# Altium project GTV3.4_Board.PrjPcb (part 5 of 11)

## Sheet Connector_Section.SchDoc
size 420 x 297 mm; DocumentNumber: 17; SheetNumber: 17; SheetTotal: 17
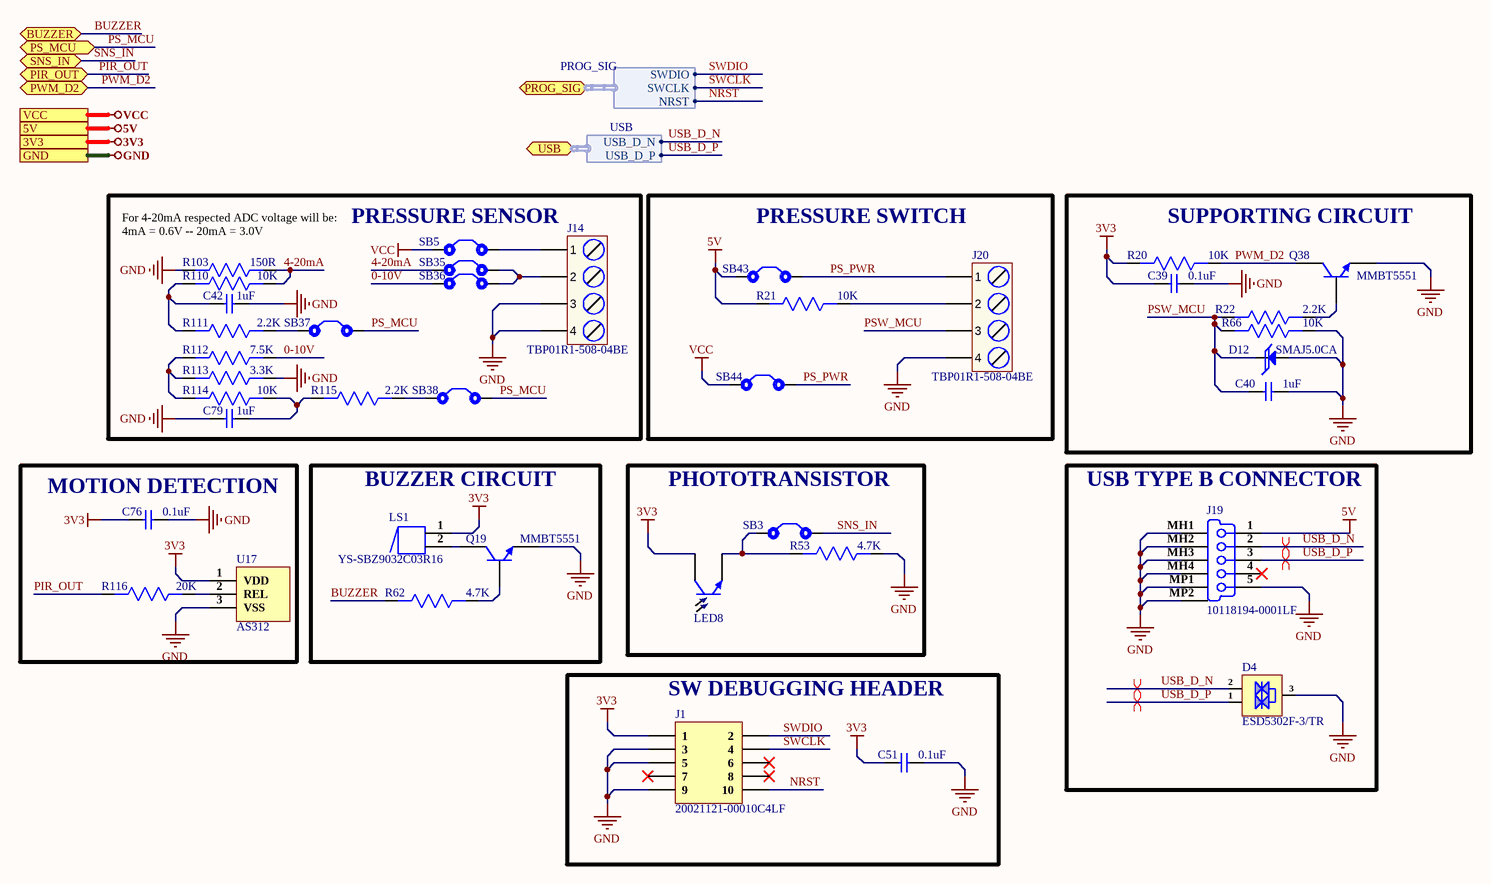
[diagram p7: Connector_Section.SchDoc]

### Parts
C39  0.1uF  [Cap0603]
C40  1uF  [Cap0603]
C42  1uF  [Cap-0603]
C51  0.1uF  [Cap0603]
C76  0.1uF  [Cap0603]
C79  1uF  [Cap-0603]
D4  ESD5302F-3/TR  [Sot-23]
D12  SMAJ5.0CA  [SMA]
J1  20021121-00010C4LF  [20021121-00010C4LF_]
J14  TBP01R1-508-04BE  [TBP01R1-508-04BE]
J19  10118194-0001LF  [10118194-0001LF_]
J20  TBP01R1-508-04BE  [TBP01R1-508-04BE]
LED8  ALS-PT19-315C/L177/TR8  [ALS-PT19-315C/L177/TR]  (value not drawn)
LS1  YS-SBZ9032C03R16  [YS-SBZ9032C03R16]
Q19  MMBT5551  [SOT-23]
Q38  MMBT5551  [SOT-23]
R20  10K  [RES-0603]
R21  10K  [RES-0603]
R22  2.2K  [RES-0603]
R53  4.7K  [RES-0603]
R62  4.7K  [RES-0603]
R66  10K  [RES-0603]
R103  150R  [Res-0603]
R110  10K  [Res-0603]
R111  2.2K  [Res-0603]
R112  7.5K  [Res-0603]
R113  3.3K  [Res-0603]
R114  10K  [Res-0603]
R115  2.2K  [Res-0603]
R116  20K  [Res-0603]
SB3  Solder Bridge  [Solder Bridge]  (value not drawn)
SB5  Solder Bridge  [Solder Bridge]  (value not drawn)
SB35  Solder Bridge  [Solder Bridge]  (value not drawn)
SB36  Solder Bridge  [Solder Bridge]  (value not drawn)
SB37  Solder Bridge  [Solder Bridge]  (value not drawn)
SB38  Solder Bridge  [Solder Bridge]  (value not drawn)
SB43  Solder Bridge  [Solder Bridge]  (value not drawn)
SB44  Solder Bridge  [Solder Bridge]  (value not drawn)
U17  AS312  [AS312]

### Blocks framed on the sheet
PRESSURE SENSOR: C42 C79 J14 R103 R110-R115 SB5 SB35-SB38
PRESSURE SWITCH: J20 R21 SB43 SB44
SUPPORTING CIRCUIT: C39 C40 D12 Q38 R20 R22 R66
MOTION DETECTION: C76 R116 U17
BUZZER CIRCUIT: LS1 Q19 R62
PHOTOTRANSISTOR: LED8 R53 SB3
USB TYPE B CONNECTOR: D4 J19
SW DEBUGGING HEADER: C51 J1

### Ports
3V3, 5V, BUZZER (bidir), GND, PIR_OUT (bidir), PROG_SIG (bidir, harness PROG_SIG), PS_MCU (bidir), PWM_D2 (bidir), SNS_IN (bidir), USB (bidir, harness USB), VCC

### Harnesses
PROG_SIG: SWDIO, SWCLK, NRST
USB: USB_D_N, USB_D_P

### Nets
3V3: C39.1 C51.1 C76.1 J1.1 LED8.1(C) LS1.1 R20.2 U17.1(VDD) ; port 3V3
5V: J19.1(V_BUS_(5V)) R21.2 SB43.1 ; port 5V
GND: C39.2 C40.2 C42.2 C51.2 C76.2 C79.1 D4.3(GND) D12.2(A) J1.3 J1.5 J1.9 J14.3 J14.4 J19.5(GND) J19.MH1(Tab) J19.MH2(Tab) J19.MH3(Tab) J19.MH4(Tab) J19.MP1(Tab) J19.MP2(Tab) J20.4 Q19.2(E) Q38.2(E) R53.1 R66.1 R103.2 R113.1 U17.3(VSS) ; port GND
VCC: SB5.1 SB44.1 ; port VCC
0-10V: R112.1 SB36.1
4-20mA: R103.1 R110.1 SB35.1
BUZZER: R62.2 ; port BUZZER
NRST: J1.10 ; port PROG_SIG.NRST
PIR_OUT: R116.2 ; port PIR_OUT
PS_MCU: SB37.2 SB38.2 ; port PS_MCU
PS_PWR: J20.1 SB43.2 SB44.2
PSW_MCU: C40.1 D12.1(K) J20.3 R22.2 R66.2
PWM_D2: Q38.3(C) R20.1 ; port PWM_D2
SNS_IN: SB3.2 ; port SNS_IN
SWCLK: J1.4 ; port PROG_SIG.SWCLK
SWDIO: J1.2 ; port PROG_SIG.SWDIO
USB_D_N: D4.2(I/O2) J19.2(D-) ; port USB.USB_D_N
USB_D_P: D4.1(I/O1) J19.3(D+) ; port USB.USB_D_P
NetC42_1: C42.1 R110.2 R111.2
NetC79_2: C79.2 R114.1 R115.2
NetJ14_1: J14.1 SB5.2
NetJ14_2: J14.2 SB35.2 SB36.2
NetJ20_2: J20.2 R21.1
NetLED8_2: LED8.2(E) R53.2 SB3.1
NetLS1_2: LS1.2 Q19.3(C)
NetQ19_1: Q19.1(B) R62.1
NetQ38_1: Q38.1(B) R22.1
NetR111_1: R111.1 SB37.1
NetR112_2: R112.2 R113.2 R114.2
NetR115_1: R115.1 SB38.1
NetR116_1: R116.1 U17.2(REL)

Not connected (* = marked no-connect by the designer): J1 6* 7* 8*; J19 4(NC)*

### Layout directives
differential pair; differential pair class USB_D_Lines; net class USB_D; rule Matched Net Lengths [Tolerance = 50mil]; rule Impedance Constraint [Min = 85.00    Max = 90.00    ]: USB_D_N, USB_D_P

### Notes on the sheet
- For 4-20mA respected ADC voltage will be:
  4mA = 0.6V -- 20mA = 3.0V
- File:
- Title:
- Date:
- Page
- Num:
- Total:
- Drawn By: Huzaifa Ali

### Library data of the parts
C39 C51 C76 = CC0603ZRY5V9BB104: CAP CER 0.1UF 50V Y5V 0603; Manufacturer: Yageo; Capacitance: 100nF; Tolerance: 80%; Supplier 1: Digi-Key; Manufacturer Part Number: CC0603ZRY5V9BB104; Stock 1: 15000880; Pricing 1: 1=0.1, 10=0.075, 100=0.0334, 500=0.02386, 1000=0.01874 (USD); Mount: Surface Mount; Case/Package: 0603; Number of Pins: 2; Case Code (Metric): 1608; Case Code (Imperial): 0603; Min Operating Temperature: -30°C; Max Operating Temperature: 85°C; Dielectric: Y5V; Voltage Rating: 50V; Package Quantity: 1; Packaging: Tape and Reel; Voltage Rating (DC): 50V; Termination: SMD/SMT; Composition: Ceramic; Voltage: 50V; Length: 1.6mm; Height: 0.8mm; Width: 0.031inch; Thickness: 0.035inch; Depth: 0.8mm; Radiation Hardening: No; REACH SVHC: No SVHC; Lead Free: Lead Free; Halogen Free: Halogen Free; ComponentLink1URL: http://www.yageo.com/documents/recent/UPY-GPHC_Y5V_6.3V-to-50V_8.pdf?src-supplier=Digi-Key; ComponentLink1Description: http://www.yageo.com/documents/recent/UPY-GPHC_Y5V_6.3V-to-50V_8.pdf?src-supplier=Digi-Key; ComponentLink2URL: http://www.yageo.com/documents/recent/UPY-GPHC_Y5V_6.3V-to-50V_5.pdf?src-supplier=Avnet+Europe; ComponentLink2Description: http://www.yageo.com/documents/recent/UPY-GPHC_Y5V_6.3V-to-50V_5.pdf?src-supplier=Avnet+Europe; ComponentLink3URL: https://www.verical.com/server-webapp/html/getDatasheet?partID=403611&src-supplier=Verical; ComponentLink3Description: https://www.verical.com/server-webapp/html/getDatasheet?partID=403611&src-supplier=Verical; ComponentLink4URL: http://www.mouser.com/ds/2/447/Yageo_UPY-GP_NP0_16V-to-50V_9-358835.pdf?src-supplier=Mouser; ComponentLink4Description: http://www.mouser.com/ds/2/447/Yageo_UPY-GP_NP0_16V-to-50V_9-358835.pdf?src-supplier=Mouser; ComponentLink5URL: http://www.farnell.com/datasheets/1132289.pdf?src-supplier=Element14; ComponentLink5Description: http://www.farnell.com/datasheets/1132289.pdf?src-supplier=Element14; Supplier Part Number 1: 311-1343-1-ND
C40 C42 C79 = CC0603KRX5R8BB105: CAP CER 1UF 25V X5R 0603; Manufacturer: Yageo; Tolerance: 10%; Supplier 1: Digi-Key; Manufacturer Part Number: CC0603KRX5R8BB105; Mount: Surface Mount; Case/Package: 0603; Number of Pins: 2; Case Code (Metric): 1608; Case Code (Imperial): 0603; Min Operating Temperature: -55°C; Max Operating Temperature: 85°C; Capacitance: 1uF; Dielectric: X5R; Package Quantity: 1; Voltage Rating: 25V; Packaging: Tape and Reel; Termination: SMD/SMT; Voltage Rating (DC): 25V; Length: 1.6mm; Height: 0.8mm; Width: 0.031inch; Thickness: 0.035inch; Depth: 0.8mm; Radiation Hardening: No; REACH SVHC: No SVHC; Lead Free: Lead Free; Halogen Free: Halogen Free
  C40: Stock 1: 1419041; Pricing 1: 1=0.1, 10=0.069, 100=0.0307, 500=0.0219, 1000=0.0172 (USD); ComponentLink1URL: http://www.yageo.com/documents/recent/UPY-GPHC_X5R_4V-to-50V_25.pdf?src-supplier=Digi-Key; ComponentLink1Description: http://www.yageo.com/documents/recent/UPY-GPHC_X5R_4V-to-50V_25.pdf?src-supplier=Digi-Key; ComponentLink2URL: http://www.yageo.com/documents/recent/UPY-GPHC_X5R_4V-to-50V_12.pdf?src-supplier=Avnet+Europe; ComponentLink2Description: http://www.yageo.com/documents/recent/UPY-GPHC_X5R_4V-to-50V_12.pdf?src-supplier=Avnet+Europe; ComponentLink3URL: http://www.farnell.com/datasheets/1525783.pdf?src-supplier=Element14; ComponentLink3Description: http://www.farnell.com/datasheets/1525783.pdf?src-supplier=Element14; ComponentLink4URL: http://www.yageo.com/documents/recent/UPY-GPHC_X5R_4V-to-50V_12.pdf?src-supplier=Avnet; ComponentLink4Description: http://www.yageo.com/documents/recent/UPY-GPHC_X5R_4V-to-50V_12.pdf?src-supplier=Avnet; Supplier Part Number 1: 311-1445-6-ND
  C42 C79: RoHS: Yes; Category: Ceramic Capacitors; Stock 1: 919939; Pricing 1: 1=0.12000, 10=0.08400, 50=0.04760, 100=0.03940, 500=0.02764, 1000=0.02288 (USD); Series: CC; Construction: Flat; RoHS Compliant: Yes; ComponentLink1URL: https://datasheet.ciiva.com/176/mlccorderingcode-176785.pdf?src-supplier=Digi-Key; ComponentLink1Description: https://datasheet.ciiva.com/176/mlccorderingcode-176785.pdf?src-supplier=Digi-Key; ComponentLink2URL: https://datasheet.ciiva.com/176/mlccorderingcode-176786.pdf?src-supplier=Digi-Key; ComponentLink2Description: https://datasheet.ciiva.com/176/mlccorderingcode-176786.pdf?src-supplier=Digi-Key; ComponentLink3URL: https://datasheet.ciiva.com/176/mlccorderingcode-176787.pdf?src-supplier=Digi-Key; ComponentLink3Description: https://datasheet.ciiva.com/176/mlccorderingcode-176787.pdf?src-supplier=Digi-Key; ComponentLink4URL: https://datasheet.ciiva.com/17436/upy-gphc-x5r-4v-to-50v-12-17436952.pdf?src-supplier=Avnet+Europe; ComponentLink4Description: https://datasheet.ciiva.com/17436/upy-gphc-x5r-4v-to-50v-12-17436952.pdf?src-supplier=Avnet+Europe; ComponentLink5URL: https://datasheet.ciiva.com/7978/1525783-7978171.pdf?src-supplier=Element14; ComponentLink5Description: https://datasheet.ciiva.com/7978/1525783-7978171.pdf?src-supplier=Element14; ComponentLink6URL: https://datasheet.ciiva.com/11586/upy-gphc-x5r-4v-to-50v-12-11586318.pdf?src-supplier=Avnet; ComponentLink6Description: https://datasheet.ciiva.com/11586/upy-gphc-x5r-4v-to-50v-12-11586318.pdf?src-supplier=Avnet; Supplier Part Number 1: 311-1445-1-ND; LCSC Part Number: C14664
D4 = ESD5302F-3/TR: 16A 20V 7V 5V@Max Unidirectional SOT-23 TVS ROHS; Manufacturer: WILLSEMI; Item Type: Diode; Manufacturer Part Number: ESD5302F-3/TR; Package: SOT-23; LCSC Part Number: C239643; ComponentLink1Description: LCSC; ComponentLink1URL: https://www.lcsc.com/product-detail/TVS_WILLSEMI-Will-Semicon-ESD5302F-3-TR_C239643.html
D12 = SMAJ5.0CA: TVS DIODE 5VWM 9.2VC SMA; Manufacturer: FTR; Item Type: C693487; Manufacturer Part Number: SMAJ5.0CA; Package: SMA(DO-214AC); LCSC Part Number: Diode; ComponentLink1Description: LCSC; ComponentLink1URL: https://www.lcsc.com/product-detail/TVS_GOODWORK-SMAJ5-0CA_C908809.html
J1 = 20021121-00010C4LF: CONN HEADER SMD 10POS 1.27MM; Manufacturer: Amphenol FCI; Number of Contacts: 10; Contact Resistance: 30mR; Current Rating: 1A; Voltage Rating: 125V; Insulation Resistance: 100MR; Gender: Male; Connector Type: Male Pin,Header; Row Spacing: 0.05inch; Stack Height: 3mm; Item Type: Jtag Header; Supplier 1: Digi-Key; Manufacturer Part Number: 20021121-00010C4LF; Stock 1: 0; Pricing 1: 1=0.87, 10=0.761, 100=0.6563 (USD); Mount: Surface Mount; Contact Plating: Gold; Contact Material: Copper Alloy,Copper,Gold; Color: Black; Housing Color: Black; Housing Material: Thermoplastic; Min Operating Temperature: -40°C; Max Operating Temperature: 85°C; Number of Rows: 2; Termination: Solder; Packaging: Tape and Reel; Package Quantity: 600; Number of Positions: 10; Max Voltage Rating (AC): 125V; Orientation: Straight; Length: 6.35mm; Pitch: 1.27mm; Contact Mating Length: 0.12inch; Depth: 3.4mm; Radiation Hardening: No; REACH SVHC: No SVHC; ComponentLink1URL: https://www.verical.com/server-webapp/html/getDatasheet?partID=177140&src-supplier=Verical; ComponentLink1Description: https://www.verical.com/server-webapp/html/getDatasheet?partID=177140&src-supplier=Verical; ComponentLink2URL: http://portal.fciconnect.com/Comergent/fci/drawing/20021121.pdf?src-supplier=Avnet; ComponentLink2Description: http://portal.fciconnect.com/Comergent/fci/drawing/20021121.pdf?src-supplier=Avnet; ComponentLink3URL: https://cdn.amphenol-icc.com/media/wysiwyg/files/drawing/20021121.pdf?src-supplier=Digi-Key; ComponentLink3Description: https://cdn.amphenol-icc.com/media/wysiwyg/files/drawing/20021121.pdf?src-supplier=Digi-Key; ComponentLink4URL: http://portal.fciconnect.com/Comergent/fci/drawing/20021121.pdf?src-supplier=Avnet+Europe; ComponentLink4Description: http://portal.fciconnect.com/Comergent/fci/drawing/20021121.pdf?src-supplier=Avnet+Europe; ComponentLink5URL: https://media.digikey.com/pdf/Data%20Sheets/FCI%20PDFs/Minitek%20127_Catalog.pdf?src-supplier=Digi-Key; ComponentLink5Description: https://media.digikey.com/pdf/Data%20Sheets/FCI%20PDFs/Minitek%20127_Catalog.pdf?src-supplier=Digi-Key; ComponentLink6URL: http://portal.fciconnect.com/Comergent//fci/drawing/20021121.pdf?src-supplier=Mouser; ComponentLink6Description: http://portal.fciconnect.com/Comergent//fci/drawing/20021121.pdf?src-supplier=Mouser; Supplier Part Number 1: 609-3695-6-ND; LCSC Part Number: C150517
J14 J20 = TBP01R1-508-04BE: TERMINAL BLOCK, PLUGGABLE, 5.08,; Manufacturer: CUI Devices; Supplier 1: Arrow Electronics; Manufacturer Part Number: TBP01R1-508-04BE; RoHS: Yes; Category: Terminal Blocks; Stock 1: 697; Pricing 1: 1=0.77380, 10=0.29040, 25=0.28750, 50=0.25070, 200=0.24820, 400=0.24580, 600=0.22570 (USD); Supplier Part Number 1: TBP01R1-508-04BE
J19 = 10118194-0001LF: CONN RCPT USB2.0 MICRO B SMD R/A; Manufacturer: Amphenol FCI; Gender: Receptacle; Current Rating: 1.8A; Connector Type: USB,Receptacle; Number of Contacts: 5; Insulation Resistance: 1GR; Number of Ports: 1; Max Voltage Rating (AC): 100V; Pitch: 0.65mm; Item Type: USB Connector; Supplier 1: Digi-Key; Manufacturer Part Number: 10118194-0001LF; Stock 1: 35943; Pricing 1: 1=0.43, 10=0.405, 25=0.3648, 50=0.3242, 100=0.3107, 250=0.28368, 500=0.27016 (USD); Mount: Surface Mount,Horizontal; Color: Black; Contact Material: Copper Alloy; Contact Plating: Gold; Number of Terminals: 5; Housing Material: Polymer; Min Operating Temperature: -55°C; Max Operating Temperature: 85°C; Package Quantity: 9600; Packaging: Tape and Reel; Termination: Solder; Orientation: Right Angle; Features: Shielded; Length: 8.05mm; Depth: 5mm; Radiation Hardening: No; Lead Free: Lead Free; Flammability Rating: UL94 V-0; ComponentLink1URL: http://www.amphenol-icc.com/media/wysiwyg/files/drawing/10118194.pdf?src-supplier=Digi-Key; ComponentLink1Description: http://www.amphenol-icc.com/media/wysiwyg/files/drawing/10118194.pdf?src-supplier=Digi-Key; ComponentLink2URL: https://cdn.amphenol-icc.com/media/wysiwyg/files/drawing/10118194.pdf?src-supplier=Mouser; ComponentLink2Description: https://cdn.amphenol-icc.com/media/wysiwyg/files/drawing/10118194.pdf?src-supplier=Mouser; ComponentLink3URL: https://cdn.amphenol-icc.com/media/wysiwyg/files/drawing/10118194.pdf?src-supplier=Verical; ComponentLink3Description: https://cdn.amphenol-icc.com/media/wysiwyg/files/drawing/10118194.pdf?src-supplier=Verical; Supplier Part Number 1: 609-4618-1-ND; LCSC Part Number: C132563
LED8 = ALS-PT19-315C/L177/TR8: SENSOR PHOTO 630NM 2SMD; Manufacturer: Everlight; Rise Time: 0.11ms; Fall Time: 0.22ms; Lens Style: Flat; Collector Emitter Breakdown Voltage: 5.5V; Polarity: NPN; Number of Elements: 1; Dark Current: 100nA; Supplier 1: Digi-Key; Manufacturer Part Number: ALS-PT19-315C/L177/TR8; RoHS: Yes; Category: Sensors; Stock 1: 41849; Pricing 1: 1=0.46000, 5=0.41800, 10=0.37100, 25=0.33200, 50=0.29180, 100=0.24880, 500=0.20576, 1000=0.17226 (USD); Mount: Surface Mount; Case/Package: SMD/SMT; Number of Pins: 2; Min Operating Temperature: -40°C; Max Operating Temperature: 85°C; Wavelength: 630nm; Packaging: Tape and Reel; Package Quantity: 1; Max Breakdown Voltage: 5.5V; Radiation Hardening: No; RoHS Compliant: Yes; ComponentLink1URL: https://datasheet.ciiva.com/12092/als-pt19-315c-l177-tr-datasheet-34741-12092024.pdf?src-supplier=Mouser; ComponentLink1Description: https://datasheet.ciiva.com/12092/als-pt19-315c-l177-tr-datasheet-34741-12092024.pdf?src-supplier=Mouser; ComponentLink2URL: https://datasheet.ciiva.com/4270/alspt19315cl177-tr8-1810-4270796.pdf?src-supplier=Arrow+Electronics; ComponentLink2Description: https://datasheet.ciiva.com/4270/alspt19315cl177-tr8-1810-4270796.pdf?src-supplier=Arrow+Electronics; Supplier Part Number 1: 1080-1244-1-ND
LS1 = YS-SBZ9032C03R16: NO 2700Hz 85dB @ 3V, 10cm 3V Φ9mm SMD,9x3.2mm Buzzers RoHS; Manufacturer: Fengming; Operating Voltage: 2 ~ 4V; Package: SMD,9x3.2mm; Frequency - Self Resonant: 2700Hz; Rated Voltage: 3V
Q19 Q38 = MMBT5551: TRANS NPN 160V 0.6A SOT-23; Manufacturer: ON Semiconductor; Manufacturer Part Number: MMBT5551LT1G; Max Power Dissipation: 225mW; Max Collector Current: 600mA; Collector Base Voltage (VCBO): 180V; Emitter Base Voltage (VEBO): 6V; Element Configuration: Single; hFE Min: 80; Power Dissipation: 300mW; Number of Elements: 1; Collector Emitter Saturation Voltage: 150mV; Collector-emitter Voltage-Max: 200mV; Supplier 1: Digi-Key; RoHS: Yes; Category: BJTs; Pricing 1: 1=0.22000, 10=0.17700, 100=0.09370, 500=0.06162, 1000=0.04190 (USD); Case/Package: SOT-23-3; Number of Pins: 3; Weight: 0.01lb; Contact Plating: Tin,Matte; Min Operating Temperature: -55°C; Max Operating Temperature: 150°C; Packaging: Tape and Reel; Collector Emitter Voltage (VCEO): 160V; Polarity: NPN; Package Quantity: 1; Collector Emitter Breakdown Voltage: 160V; Current Rating: 600mA; Voltage Rating (DC): 160V; Max Breakdown Voltage: 160V; Series: -; Length: 2.9mm; Width: 1.3mm; Height: 0.94mm; Radiation Hardening: No; Lead Free: Lead Free; REACH SVHC: No SVHC; RoHS Compliant: Yes; ComponentLink1URL: https://datasheet.ciiva.com/976/mmbt5550lt1-d-976512.pdf?src-supplier=Digi-Key; ComponentLink1Description: https://datasheet.ciiva.com/976/mmbt5550lt1-d-976512.pdf?src-supplier=Digi-Key; ComponentLink2URL: https://datasheet.ciiva.com/34303/2011387-34303825.pdf?src-supplier=Jameco; ComponentLink2Description: https://datasheet.ciiva.com/34303/2011387-34303825.pdf?src-supplier=Jameco; ComponentLink3URL: https://datasheet.ciiva.com/15139/getdatasheetpartid-92641-15139178.pdf?src-supplier=Verical; ComponentLink3Description: https://datasheet.ciiva.com/15139/getdatasheetpartid-92641-15139178.pdf?src-supplier=Verical; ComponentLink4URL: https://datasheet.ciiva.com/16984/0900766b8078eb1b-16984971.pdf?src-supplier=Allied+Electronics; ComponentLink4Description: https://datasheet.ciiva.com/16984/0900766b8078eb1b-16984971.pdf?src-supplier=Allied+Electronics; ComponentLink5URL: https://datasheet.ciiva.com/976/mmbt5550lt1-d-976513.pdf?src-supplier=Digi-Key; ComponentLink5Description: https://datasheet.ciiva.com/976/mmbt5550lt1-d-976513.pdf?src-supplier=Digi-Key; ComponentLink6URL: https://datasheet.ciiva.com/4722/mmbt5550lt1-d-111393-4722711.pdf?src-supplier=Mouser; ComponentLink6Description: https://datasheet.ciiva.com/4722/mmbt5550lt1-d-111393-4722711.pdf?src-supplier=Mouser; ComponentLink7URL: https://datasheet.ciiva.com/16478/mmbt5550lt1-d-16478568.pdf?src-supplier=Avnet+Asia; ComponentLink7Description: https://datasheet.ciiva.com/16478/mmbt5550lt1-d-16478568.pdf?src-supplier=Avnet+Asia; ComponentLink8URL: https://datasheet.ciiva.com/7972/mmbt5550lt1-d-7972073.pdf?src-supplier=Element14; ComponentLink8Description: https://datasheet.ciiva.com/7972/mmbt5550lt1-d-7972073.pdf?src-supplier=Element14; ComponentLink9URL: https://datasheet.ciiva.com/25997/mmbt5550lt1-d-25997449.pdf?src-supplier=Avnet+Europe; ComponentLink9Description: https://datasheet.ciiva.com/25997/mmbt5550lt1-d-25997449.pdf?src-supplier=Avnet+Europe; ComponentLink10URL: https://datasheet.ciiva.com/7972/mmbt5550lt1-d-7972075.pdf?src-supplier=Element14; ComponentLink10Description: https://datasheet.ciiva.com/7972/mmbt5550lt1-d-7972075.pdf?src-supplier=Element14; ComponentLink11URL: https://datasheet.ciiva.com/11197/mmbt5550lt1-d-11197404.pdf?src-supplier=Avnet; ComponentLink11Description: https://datasheet.ciiva.com/11197/mmbt5550lt1-d-11197404.pdf?src-supplier=Avnet; ComponentLink12URL: https://datasheet.ciiva.com/976/mmbt5550lt1-d-976511.pdf?src-supplier=Digi-Key; ComponentLink12Description: https://datasheet.ciiva.com/976/mmbt5550lt1-d-976511.pdf?src-supplier=Digi-Key; ComponentLink13URL: https://datasheet.ciiva.com/16342/mmbt5550lt1-d-16342687.pdf?src-supplier=Future+Electronics; ComponentLink13Description: https://datasheet.ciiva.com/16342/mmbt5550lt1-d-16342687.pdf?src-supplier=Future+Electronics; Supplier Part Number 1: MMBT5551LT1GOSDKR-ND
R20 R21 R66 = AC0603JR-0710KL: RES SMD 10K OHM 5% 1/10W 0603; Manufacturer: Yageo; Voltage Rating: 50V; Resistance: 10kR; Power Rating: 100mW; Temperature Coefficient: 100ppm/°C; Supplier 1: Future Electronics; Manufacturer Part Number: AC0603JR-0710KL; RoHS: Yes; Category: Chip SMD Resistors; Stock 1: 1533000; Pricing 1: 5000=0.00540 (USD); Case/Package: 0603; Case Code (Imperial): 0603; Case Code (Metric): 1608; Size Code: 0603; Min Operating Temperature: -55°C; Max Operating Temperature: 155°C; Packaging: Tape and Reel; Tolerance: 5%; Package Quantity: 1; Resistor Type: Thick Film; Termination: SMD/SMT; Number of Terminations: 2; Max Power Dissipation: 100mW; Features: Moisture Resistant,Automotive AEC-Q200,Anti-Sulfur; Series: AC; Construction: Rectangular; Length: 0.063inch; Width: 0.031inch; Height: 0.022inch; Depth: 0.8mm; Military Standard: Not; Lead Free: Lead Free; RoHS Compliant: Yes; ComponentLink1URL: https://datasheet.ciiva.com/5562/pyu-ac-51-rohs-l-2-5562553.pdf?src-supplier=Mouser; ComponentLink1Description: https://datasheet.ciiva.com/5562/pyu-ac-51-rohs-l-2-5562553.pdf?src-supplier=Mouser; Supplier Part Number 1: 1029044
R22 = RC0603FR-072K2L: RES SMD 2.2K OHM 1% 1/10W 0603; Manufacturer: Yageo Phycomp; Temperature Coefficient: 100ppm/°C; Resistance: 2.2kR; Power Rating: 100mW; Voltage Rating (DC): 50V; Supplier 1: Digi-Key; Manufacturer Part Number: RC0603FR-072K2L; Stock 1: 10587920; Pricing 1: 1=0.1, 10=0.023, 100=0.0094, 1000=0.00421, 2500=0.00366 (USD); Mount: Surface Mount; Case/Package: 0603; Number of Pins: 2; Min Operating Temperature: -55°C; Max Operating Temperature: 155°C; Tolerance: 1%; Packaging: Cut Tape; Length: 1.6mm; Height: 0.45mm; Width: 800um; Depth: 0.8mm; REACH SVHC: No SVHC; Lead Free: Lead Free; Supplier Part Number 1: 311-2.20KHRCT-ND
R53 = RC0603FR-074K7L: RES SMD 4.7K OHM 1% 1/10W 0603; Manufacturer: Yageo; Resistance: 4.7kR; Temperature Coefficient: 100ppm/°C; Voltage Rating (DC): 50V; Power Rating: 100mW; Supplier 1: Digi-Key; Manufacturer Part Number: RC0603FR-074K7L; Stock 1: 1924316; Pricing 1: 1=0.10000, 10=0.02400, 100=0.00970, 1000=0.00436, 2500=0.00378 (USD); Case/Package: 0603; Number of Pins: 2; Case Code (Imperial): 0603; Case Code (Metric): 1608; Min Operating Temperature: -55°C; Max Operating Temperature: 155°C; Tolerance: 1%; Packaging: Tape and Reel; Voltage Rating: 50V; Termination: SMD/SMT; Military Standard: Not; Length: 1.6mm; Width: 0.8mm; Depth: 0.8mm; REACH SVHC: No SVHC; Lead Free: Lead Free; ComponentLink1URL: https://datasheet.ciiva.com/15189/getdatasheetpartid-422754-15189760.pdf?src-supplier=Verical; ComponentLink1Description: https://datasheet.ciiva.com/15189/getdatasheetpartid-422754-15189760.pdf?src-supplier=Verical; Supplier Part Number 1: 311-4.70KHRCT-ND; RoHS: Yes; Category: Chip SMD Resistors; Size Code: 0603; Resistor Type: Thick Film; Features: Moisture Resistant; Series: RC; Max Power Dissipation: 100mW; Number of Terminations: 2; Construction: Rectangular; Resistance Tolerance: 1%; Height: 0.45mm; Lead Pitch: 0.3mm; RoHS Compliant: Yes; ComponentLink2URL: https://datasheet.ciiva.com/22747/443971-22747528.pdf?src-supplier=Element14; ComponentLink2Description: https://datasheet.ciiva.com/22747/443971-22747528.pdf?src-supplier=Element14; ComponentLink3URL: https://datasheet.ciiva.com/7660/38590-7660794.pdf?src-supplier=Element14; ComponentLink3Description: https://datasheet.ciiva.com/7660/38590-7660794.pdf?src-supplier=Element14; ComponentLink4URL: https://datasheet.ciiva.com/7746/1868787-7746365.pdf?src-supplier=Element14; ComponentLink4Description: https://datasheet.ciiva.com/7746/1868787-7746365.pdf?src-supplier=Element14; ComponentLink5URL: https://datasheet.ciiva.com/46440/1868787-46440909.pdf?src-supplier=Element14; ComponentLink5Description: https://datasheet.ciiva.com/46440/1868787-46440909.pdf?src-supplier=Element14; ComponentLink6URL: https://datasheet.ciiva.com/7746/1738695-7746366.pdf?src-supplier=Element14; ComponentLink6Description: https://datasheet.ciiva.com/7746/1738695-7746366.pdf?src-supplier=Element14
R62 = RC0603FR-074K7L: RES SMD 4.7K OHM 1% 1/10W 0603; Manufacturer: Yageo; Resistance: 4.7kR; Temperature Coefficient: 100ppm/°C; Power Rating: 100mW; Voltage Rating (DC): 50V; Supplier 1: Digi-Key; Manufacturer Part Number: RC0603FR-074K7L; RoHS: Yes; Category: Chip SMD Resistors; Stock 1: 1924316; Pricing 1: 1=0.10000, 10=0.02400, 100=0.00970, 1000=0.00436, 2500=0.00378 (USD); Case/Package: 0603; Number of Pins: 2; Case Code (Imperial): 0603; Case Code (Metric): 1608; Size Code: 0603; Min Operating Temperature: -55°C; Max Operating Temperature: 155°C; Tolerance: 1%; Resistor Type: Thick Film; Packaging: Tape and Reel; Voltage Rating: 50V; Termination: SMD/SMT; Features: Moisture Resistant; Series: RC; Max Power Dissipation: 100mW; Number of Terminations: 2; Construction: Rectangular; Resistance Tolerance: 1%; Length: 1.6mm; Width: 0.8mm; Height: 0.45mm; Depth: 0.8mm; Lead Pitch: 0.3mm; REACH SVHC: No SVHC; Lead Free: Lead Free; RoHS Compliant: Yes; Military Standard: Not; ComponentLink1URL: https://datasheet.ciiva.com/15189/getdatasheetpartid-422754-15189760.pdf?src-supplier=Verical; ComponentLink1Description: https://datasheet.ciiva.com/15189/getdatasheetpartid-422754-15189760.pdf?src-supplier=Verical; ComponentLink2URL: https://datasheet.ciiva.com/22747/443971-22747528.pdf?src-supplier=Element14; ComponentLink2Description: https://datasheet.ciiva.com/22747/443971-22747528.pdf?src-supplier=Element14; ComponentLink3URL: https://datasheet.ciiva.com/7660/38590-7660794.pdf?src-supplier=Element14; ComponentLink3Description: https://datasheet.ciiva.com/7660/38590-7660794.pdf?src-supplier=Element14; ComponentLink4URL: https://datasheet.ciiva.com/7746/1868787-7746365.pdf?src-supplier=Element14; ComponentLink4Description: https://datasheet.ciiva.com/7746/1868787-7746365.pdf?src-supplier=Element14; ComponentLink5URL: https://datasheet.ciiva.com/46440/1868787-46440909.pdf?src-supplier=Element14; ComponentLink5Description: https://datasheet.ciiva.com/46440/1868787-46440909.pdf?src-supplier=Element14; ComponentLink6URL: https://datasheet.ciiva.com/7746/1738695-7746366.pdf?src-supplier=Element14; ComponentLink6Description: https://datasheet.ciiva.com/7746/1738695-7746366.pdf?src-supplier=Element14; Supplier Part Number 1: 311-4.70KHRCT-ND
R103 = RC0603DR-07150RL: RES 150 OHM 0.5% 1/10W 0603; Manufacturer: Yageo; Max Power Dissipation: 100mW; Temperature Coefficient: 100ppm/°C; Supplier 1: Mouser; Manufacturer Part Number: RC0603DR-07150RL; RoHS: Yes; Category: Chip SMD Resistors; Pricing 1: 1=0.13000, 10=0.07000, 50=0.07000, 100=0.02900, 1000=0.01300, 10000=0.00700 (USD); Case/Package: 0603; Min Operating Temperature: -55°C; Max Operating Temperature: 155°C; Packaging: Tape and Reel; Resistance: 150R; Resistor Type: Thick Film; Number of Terminations: 2; Tolerance: 0.5%; Features: Moisture Resistant; Length: 0.063inch; Width: 0.031inch; Height: 0.022inch; RoHS Compliant: Yes; ComponentLink1URL: http://www.yageo.com.tw/exep/pages/download/literatures/PYu-R_INT-thick_7.pdf?src-supplier=Digi-Key; ComponentLink1Description: http://www.yageo.com.tw/exep/pages/download/literatures/PYu-R_INT-thick_7.pdf?src-supplier=Digi-Key; Supplier Part Number 1: 603-RC0603DR-07150RL
R110 R114 = RC0603FR-0710KL: RES SMD 10K Ohm 1% 1/10W 0603; Manufacturer: Yageo; Resistance: 10kR; Temperature Coefficient: 100ppm/°C; Voltage Rating (DC): 50V; Power Rating: 100mW; Voltage Rating: 75V; Supplier 1: Digi-Key; Manufacturer Part Number: RC0603FR-0710KL; RoHS: Yes; Category: Chip SMD Resistors; Stock 1: 25249139; Pricing 1: 1=0.10000, 10=0.02400, 100=0.00970, 1000=0.00436, 2500=0.00378 (USD); Case/Package: 0603; Number of Pins: 2; Case Code (Imperial): 0603; Case Code (Metric): 1608; Weight: 7.1E-05oz; Size Code: 0603; Min Operating Temperature: -55°C; Max Operating Temperature: 155°C; Tolerance: 1%; Resistor Type: Thick Film; Packaging: Tape and Reel; Termination: SMD/SMT; Features: Moisture Resistant; Series: RC; Max Power Dissipation: 100mW; Number of Terminations: 2; Resistance Tolerance: 1%; Construction: Rectangular; Length: 1.6mm; Width: 0.8mm; Height: 0.45mm; Depth: 0.8mm; Lead Pitch: 0.3mm; REACH SVHC: Unknown; Lead Free: Lead Free; Military Standard: Not; RoHS Compliant: Yes; ComponentLink1URL: https://datasheet.ciiva.com/7660/38590-7660789.pdf?src-supplier=Element14; ComponentLink1Description: https://datasheet.ciiva.com/7660/38590-7660789.pdf?src-supplier=Element14; ComponentLink2URL: https://datasheet.ciiva.com/7983/443971-7983596.pdf?src-supplier=Element14; ComponentLink2Description: https://datasheet.ciiva.com/7983/443971-7983596.pdf?src-supplier=Element14; ComponentLink3URL: https://datasheet.ciiva.com/22747/443971-22747519.pdf?src-supplier=Element14; ComponentLink3Description: https://datasheet.ciiva.com/22747/443971-22747519.pdf?src-supplier=Element14; ComponentLink4URL: https://datasheet.ciiva.com/46440/1868787-46440891.pdf?src-supplier=Element14; ComponentLink4Description: https://datasheet.ciiva.com/46440/1868787-46440891.pdf?src-supplier=Element14; ComponentLink5URL: https://datasheet.ciiva.com/7746/1738695-7746239.pdf?src-supplier=Element14; ComponentLink5Description: https://datasheet.ciiva.com/7746/1738695-7746239.pdf?src-supplier=Element14; ComponentLink6URL: https://datasheet.ciiva.com/15189/getdatasheetpartid-409289-15189591.pdf?src-supplier=Verical; ComponentLink6Description: https://datasheet.ciiva.com/15189/getdatasheetpartid-409289-15189591.pdf?src-supplier=Verical; Supplier Part Number 1: 311-10.0KHRCT-ND; LCSC Part Number: C98220
R111 R115 = RC0603FR-072K2L: RES 2.2K OHM 1% 1/10W 0603; Manufacturer: Yageo; Resistance: 2.2kR; Temperature Coefficient: 100ppm/°C; Power Rating: 100mW; Voltage Rating: 50V; Item Type: Resistor; Supplier 1: Avnet; Manufacturer Part Number: RC0603FR-072K2L; RoHS: Yes; Category: Chip SMD Resistors; Stock 1: 733100; Pricing 1: 5000=0.00133, 10000=0.00131, 20000=0.00127 (USD); Case/Package: 0603; Case Code (Imperial): 0603; Case Code (Metric): 1608; Size Code: 0603; Min Operating Temperature: -55°C; Max Operating Temperature: 155°C; Tolerance: 1%; Packaging: Tape and Reel; Resistor Type: Thick Film; Package Quantity: 1; Termination: SMD/SMT; Number of Terminations: 2; Max Power Dissipation: 100mW; Features: Moisture Resistant; Series: RC; Resistance Tolerance: 1%; Construction: Rectangular; Length: 1.6mm; Width: 0.031inch; Height: 0.022inch; Depth: 0.8mm; Lead Free: Lead Free; Military Standard: Not; RoHS Compliant: Yes; Supplier Part Number 1: RC0603FR-072K2L; LCSC Part Number: C114662
R112 = RT0603BRD077K5L: RES SMD 7.5K OHM 0.1% 1/10W 0603; Manufacturer: Yageo; Resistance: 7.5kR; Power Rating: 100mW; Voltage Rating: 75V; Temperature Coefficient: 25ppm/°C; Voltage Rating (DC): 50V; Supplier 1: Digi-Key; Manufacturer Part Number: RT0603BRD077K5L; RoHS: Yes; Category: Chip SMD Resistors; Stock 1: 34037; Pricing 1: 1=0.34000, 10=0.28800, 100=0.11260, 500=0.06812, 1000=0.04716, 2500=0.04322 (USD); Case/Package: 0603; Case Code (Imperial): 0603; Case Code (Metric): 1608; Weight: 7.1E-05oz; Contact Plating: Tin,Matte; Size Code: 0603; Min Operating Temperature: -55°C; Max Operating Temperature: 125°C; Package Quantity: 5000; Packaging: Tape and Reel; Tolerance: 0.1%; Resistor Type: Thin Film; Termination: SMD/SMT; Number of Terminations: 2; Max Power Dissipation: 100mW; Features: Moisture Resistant; Series: RT; Length: 0.063inch; Width: 0.8mm; Height: 0.022inch; Radiation Hardening: No; Lead Free: Lead Free; RoHS Compliant: Yes; ComponentLink1URL: https://datasheet.ciiva.com/8891/pyu-rt-1-to-0-05-rohs-l-4-8891914.pdf?src-supplier=Avnet; ComponentLink1Description: https://datasheet.ciiva.com/8891/pyu-rt-1-to-0-05-rohs-l-4-8891914.pdf?src-supplier=Avnet; Supplier Part Number 1: YAG2311CT-ND
R113 = RC0603DR-073K3L: RES 3.3K OHM 0.5% 1/10W 0603; Manufacturer: Yageo; Resistance: 3.3kR; Max Power Dissipation: 100mW; Temperature Coefficient: 100ppm/°C; Supplier 1: Mouser; Manufacturer Part Number: RC0603DR-073K3L; RoHS: Yes; Category: Chip SMD Resistors; Pricing 1: 1=0.13000, 10=0.07000, 50=0.07000, 100=0.02900, 1000=0.01300, 10000=0.00700 (USD); Case/Package: 0603; Min Operating Temperature: -55°C; Max Operating Temperature: 155°C; Packaging: Tape and Reel; Resistor Type: Thick Film; Number of Terminations: 2; Tolerance: 0.5%; Features: Moisture Resistant; Length: 0.063inch; Width: 0.031inch; Height: 0.022inch; RoHS Compliant: Yes; ComponentLink1URL: http://www.yageo.com.tw/exep/pages/download/literatures/PYu-R_INT-thick_7.pdf?src-supplier=Digi-Key; ComponentLink1Description: http://www.yageo.com.tw/exep/pages/download/literatures/PYu-R_INT-thick_7.pdf?src-supplier=Digi-Key; Supplier Part Number 1: 603-RC0603DR-073K3L
R116 = RC0603FR-0720KL: RES 20K OHM 1% 1/10W 0603; Manufacturer: Yageo; Resistance: 20kR; Temperature Coefficient: 100ppm/°C; Voltage Rating (DC): 50V; Power Rating: 100mW; Supplier 1: Arrow Electronics; Manufacturer Part Number: RC0603FR-0720KL; RoHS: Yes; Category: Chip SMD Resistors; Stock 1: 945000; Pricing 1: 5000=0.00240, 10000=0.00220, 25000=0.00200, 50000=0.00190, 125000=0.00180 (USD); Case/Package: 0603; Number of Pins: 2; Case Code (Imperial): 0603; Case Code (Metric): 1608; Size Code: 0603; Min Operating Temperature: -55°C; Max Operating Temperature: 155°C; Tolerance: 1%; Packaging: Tape and Reel; Resistor Type: Thick Film; Voltage Rating: 50V; Package Quantity: 1; Termination: SMD/SMT; Number of Terminations: 2; Max Power Dissipation: 100mW; Features: Moisture Resistant; Series: RC; Technology: THICK FILM; Construction: Rectangular; Resistance Tolerance: 1%; Length: 0.063inch; Width: 0.031inch; Height: 0.022inch; Depth: 0.8mm; Lead Free: Lead Free; RoHS Compliant: Yes; REACH SVHC: No SVHC; Military Standard: Not; ComponentLink1URL: https://datasheet.ciiva.com/11808/0900766b80f96399-11808275.pdf?src-supplier=RSComponents; ComponentLink1Description: https://datasheet.ciiva.com/11808/0900766b80f96399-11808275.pdf?src-supplier=RSComponents; ComponentLink2URL: https://datasheet.ciiva.com/22747/443971-22747525.pdf?src-supplier=Element14; ComponentLink2Description: https://datasheet.ciiva.com/22747/443971-22747525.pdf?src-supplier=Element14; ComponentLink3URL: https://datasheet.ciiva.com/2453/pyu-r-int-thick-7-2453911.pdf?src-supplier=Digi-Key; ComponentLink3Description: https://datasheet.ciiva.com/2453/pyu-r-int-thick-7-2453911.pdf?src-supplier=Digi-Key; ComponentLink4URL: https://datasheet.ciiva.com/2453/pyu-r-int-thick-7-2453912.pdf?src-supplier=Digi-Key; ComponentLink4Description: https://datasheet.ciiva.com/2453/pyu-r-int-thick-7-2453912.pdf?src-supplier=Digi-Key; ComponentLink5URL: https://datasheet.ciiva.com/2453/pyu-r-int-thick-7-2453910.pdf?src-supplier=Digi-Key; ComponentLink5Description: https://datasheet.ciiva.com/2453/pyu-r-int-thick-7-2453910.pdf?src-supplier=Digi-Key; Supplier Part Number 1: RC0603FR-0720KL; LCSC Part Number: C105575
SB3 SB5 SB35-SB38 SB43 SB44 = Solder Bridge: Solder Bridge ON
U17 = AS312: Through Hole Biometric Sensors ROHS; Manufacturer: Senba; Manufacturer Part Number: AS312; ComponentLink1Description: LCSC; ComponentLink1URL: https://www.lcsc.com/product-detail/Biometric-Sensors_Senba-Sensing-Tech-AS312_C90465.html

## Sheet Temperature_Sense_Section.SchDoc
size 420 x 297 mm; DocumentNumber: 15; SheetNumber: 15; SheetTotal: 17
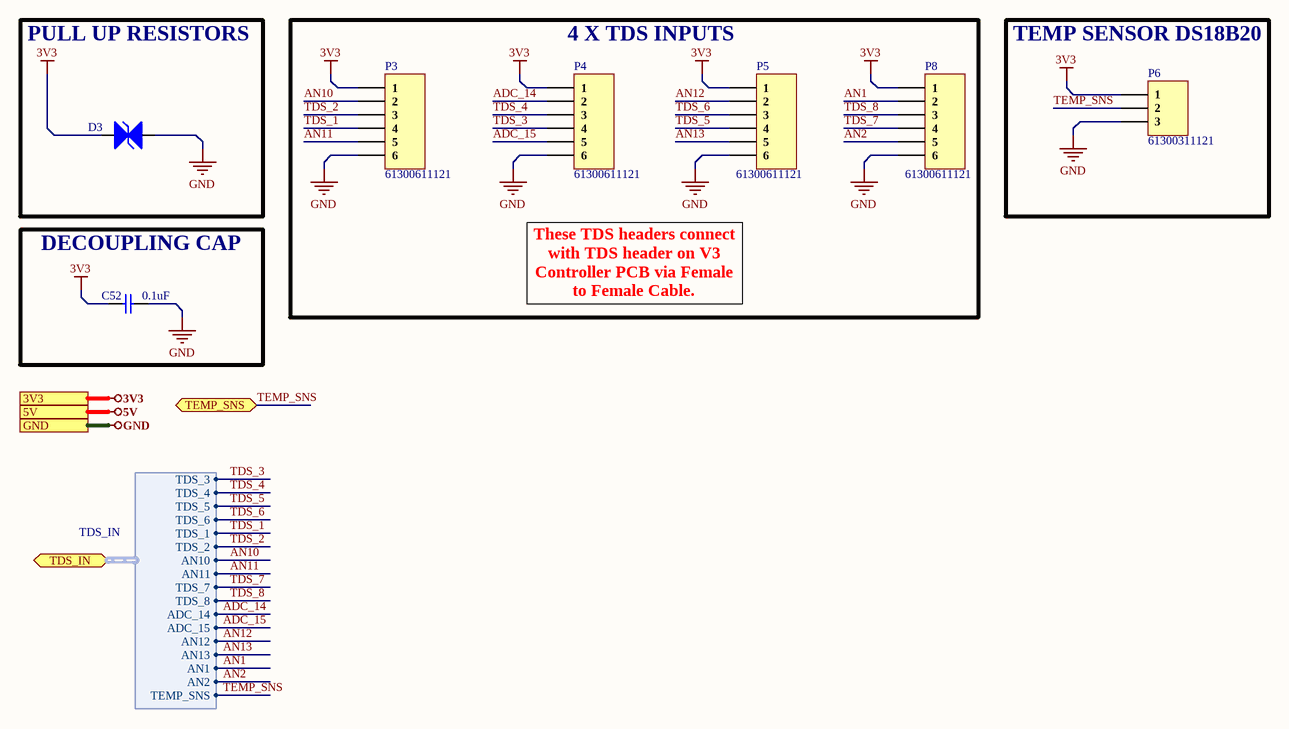
[diagram p8: Temperature_Sense_Section.SchDoc]

### Parts
C52  0.1uF  [Cap0603]
D3  SMAJ5.0CA  [SMAJ5.0CA]  (value not drawn)
P3  61300611121  [HDR1X6]
P4  61300611121  [HDR1X6]
P5  61300611121  [HDR1X6]
P6  61300311121  [HDR1X3]
P8  61300611121  [HDR1X6]

### Blocks framed on the sheet
PULL UP RESISTORS: D3
4 X TDS INPUTS: P3-P5 P8
TEMP SENSOR DS18B20: P6
DECOUPLING CAP: C52

### Ports
3V3, 5V, GND, TDS_IN (bidir, harness TDS_IN), TEMP_SNS (bidir)

### Harnesses
TDS_IN: TDS_1, TDS_2, AN10, AN11, TDS_3, TDS_4, TDS_5, TDS_6, TDS_7, TDS_8, ADC_14, ADC_15, AN12, AN13, AN1, AN2, TEMP_SNS

### Nets
3V3: C52.1 D3.2(A) P3.1 P4.1 P5.1 P6.1 P8.1 ; port 3V3
GND: C52.2 D3.1(K) P3.6 P4.6 P5.6 P6.3 P8.6 ; port GND
ADC_14: P4.2 ; port TDS_IN.ADC_14
ADC_15: P4.5 ; port TDS_IN.ADC_15
AN1: P8.2 ; port TDS_IN.AN1
AN2: P8.5 ; port TDS_IN.AN2
AN10: P3.2 ; port TDS_IN.AN10
AN11: P3.5 ; port TDS_IN.AN11
AN12: P5.2 ; port TDS_IN.AN12
AN13: P5.5 ; port TDS_IN.AN13
TDS_1: P3.4 ; port TDS_IN.TDS_1
TDS_2: P3.3 ; port TDS_IN.TDS_2
TDS_3: P4.4 ; port TDS_IN.TDS_3
TDS_4: P4.3 ; port TDS_IN.TDS_4
TDS_5: P5.4 ; port TDS_IN.TDS_5
TDS_6: P5.3 ; port TDS_IN.TDS_6
TDS_7: P8.4 ; port TDS_IN.TDS_7
TDS_8: P8.3 ; port TDS_IN.TDS_8
TEMP_SNS: P6.2 ; port TEMP_SNS, port TDS_IN.TEMP_SNS  [project net TDS_IN.TEMP_SNS]

### Notes on the sheet
- These TDS headers connect with TDS header on V3 Controller PCB via Female to Female Cable.
- File:
- Title:
- Date:
- Page
- Num:
- Total:
- Drawn By: Huzaifa Ali

### Library data of the parts
C52 = CC0603ZRY5V9BB104: as C39 on sheet Connector_Section; Supplier 1: Digi-Key; Manufacturer Part Number: CC0603ZRY5V9BB104; Stock 1: 15000880; Pricing 1: 1=0.1, 10=0.075, 100=0.0334, 500=0.02386, 1000=0.01874 (USD); Mount: Surface Mount; Case/Package: 0603; Number of Pins: 2; Case Code (Metric): 1608; Case Code (Imperial): 0603; Min Operating Temperature: -30°C; Max Operating Temperature: 85°C; Dielectric: Y5V; Voltage Rating: 50V; Package Quantity: 1; Packaging: Tape and Reel; Voltage Rating (DC): 50V; Termination: SMD/SMT; Composition: Ceramic; Voltage: 50V; Length: 1.6mm; Height: 0.8mm; Width: 0.031inch; Thickness: 0.035inch; Depth: 0.8mm; Radiation Hardening: No; REACH SVHC: No SVHC; Lead Free: Lead Free; Halogen Free: Halogen Free; ComponentLink1URL: http://www.yageo.com/documents/recent/UPY-GPHC_Y5V_6.3V-to-50V_8.pdf?src-supplier=Digi-Key; ComponentLink1Description: http://www.yageo.com/documents/recent/UPY-GPHC_Y5V_6.3V-to-50V_8.pdf?src-supplier=Digi-Key; ComponentLink2URL: http://www.yageo.com/documents/recent/UPY-GPHC_Y5V_6.3V-to-50V_5.pdf?src-supplier=Avnet+Europe; ComponentLink2Description: http://www.yageo.com/documents/recent/UPY-GPHC_Y5V_6.3V-to-50V_5.pdf?src-supplier=Avnet+Europe; ComponentLink3URL: https://www.verical.com/server-webapp/html/getDatasheet?partID=403611&src-supplier=Verical; ComponentLink3Description: https://www.verical.com/server-webapp/html/getDatasheet?partID=403611&src-supplier=Verical; ComponentLink4URL: http://www.mouser.com/ds/2/447/Yageo_UPY-GP_NP0_16V-to-50V_9-358835.pdf?src-supplier=Mouser; ComponentLink4Description: http://www.mouser.com/ds/2/447/Yageo_UPY-GP_NP0_16V-to-50V_9-358835.pdf?src-supplier=Mouser; ComponentLink5URL: http://www.farnell.com/datasheets/1132289.pdf?src-supplier=Element14; ComponentLink5Description: http://www.farnell.com/datasheets/1132289.pdf?src-supplier=Element14; Supplier Part Number 1: 311-1343-1-ND
D3 = SMAJ5.0CA: 800uA 43.5A 9.2V 6.4V 5V 7V Bi-Directional SMA TVS ROHS; Manufacturer: Shandong Jingdao Microelectronics; ComponentLink1Description: LCSC; ComponentLink1URL: https://lcsc.com/product-detail/TVS_Shandong-Jingdao-Microelectronics-SMAJ5-0CA_C353441.html; Manufacturer Part Number: SMAJ5.0CA; Footprint: SMA
P3-P5 P8 = Header 1x6: CONN HEADER VERT 6POS 2.54MM; Manufacturer: Wurth Electronics; Current Rating: 3A; Voltage Rating: 250V; Number of Positions: 6; Gender: Male; Connector Type: Male Pin; Pitch: 0.1inch; Supplier 1: Digi-Key; Manufacturer Part Number: 61300611121; Stock 1: 14573; Pricing 1: 1=0.33, 10=0.279, 25=0.232, 50=0.194, 100=0.176, 1000=0.16 (USD); Mount: Through Hole; Contact Plating: Gold; Contact Material: Copper Alloy,Copper; Housing Material: PBT; Color: Black; Min Operating Temperature: -40°C; Max Operating Temperature: 125°C; Number of Rows: 1; Contact Gender: Male; Packaging: Bulk; Termination: Through Hole; Number of Contacts: 6; Contact Mating Length: 0.236inch; REACH SVHC: Unknown; Lead Free: Lead Free; ComponentLink1URL: http://www.farnell.com/cad/1737268.pdf?src-supplier=Element14; ComponentLink1Description: http://www.farnell.com/cad/1737268.pdf?src-supplier=Element14; ComponentLink2URL: https://katalog.we-online.de/em/datasheet/6130xx11121.pdf?src-supplier=Digi-Key; ComponentLink2Description: https://katalog.we-online.de/em/datasheet/6130xx11121.pdf?src-supplier=Digi-Key; ComponentLink3URL: http://www.mouser.com/ds/2/445/6130xx11121-538006.pdf?src-supplier=Mouser; ComponentLink3Description: http://www.mouser.com/ds/2/445/6130xx11121-538006.pdf?src-supplier=Mouser; Supplier Part Number 1: 732-5319-ND
P6 = Header 1X3: CONN HEADER VERT 3POS 2.54MM; Manufacturer: Wurth Electronics; Number of Positions: 3; Gender: Male; Connector Type: Male Pin; Pitch: 0.1inch; Supplier 1: Digi-Key; Manufacturer Part Number: 61300311121; Stock 1: 81286; Pricing 1: 1=0.13, 10=0.106, 25=0.088, 50=0.074, 100=0.067, 1000=0.061 (USD); Mount: Through Hole; Contact Plating: Gold; Contact Material: Copper; Color: Black; Number of Rows: 1; Packaging: Bulk; Termination: Solder; Number of Contacts: 3; Contact Mating Length: 0.236inch; REACH SVHC: Unknown; Lead Free: Lead Free; ComponentLink1URL: http://www.farnell.com/cad/1737268.pdf?src-supplier=Element14; ComponentLink1Description: http://www.farnell.com/cad/1737268.pdf?src-supplier=Element14; ComponentLink2URL: https://katalog.we-online.de/em/datasheet/6130xx11121.pdf?src-supplier=Digi-Key; ComponentLink2Description: https://katalog.we-online.de/em/datasheet/6130xx11121.pdf?src-supplier=Digi-Key; Supplier Part Number 1: 732-5316-ND